# Altium schematic sheet ADP1741_3.6V_3.3V@2A.SchDoc
size A4
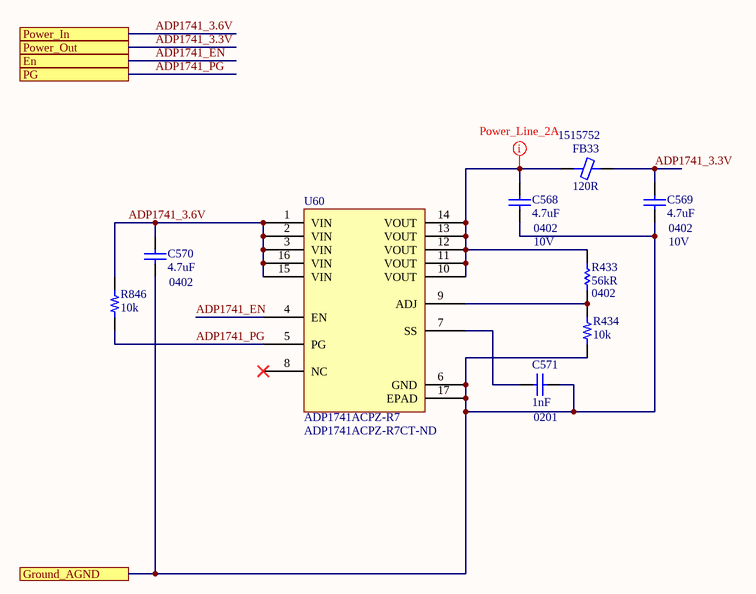
[diagram p0: ADP1741_3.6V_3.3V@2A.SchDoc]

## Parts
C568  4.7uF  Case/Package: 0402  Voltage Rating: 10V  [CAP 0402/1005 KK]
C569  4.7uF  Case/Package: 0402  Voltage Rating: 10V  [CAP 0402/1005 KK]
C570  4.7uF  Case/Package: 0402  [CAP 0402/1005 KK]
C571  1nF  Case/Package: 0201  [CAP 0201/0603 KK]
FB33  120R  Supplier Part Number 1: 1515752  [FER 0603/1608]
R433  56kR  Case/Package: 0402  [RES 0402/1005 RF KK]
R434  10k  [RES 0402/1005 RF KK]
R846  10k  [RES 0402/1005 RF KK]
U60  ADP1741ACPZ-R7  Supplier Part Number 1: ADP1741ACPZ-R7CT-ND  [ADP1752_1753/ADP1740_1741]

## Ports
En, Ground_AGND, PG, Power_In, Power_Out

## Nets
ADP1741_3.3V: C569.2 FB33.2 ; port Power_Out
ADP1741_3.6V: C570.2 R846.1 U60.1(VIN) U60.2(VIN) U60.3(VIN) U60.15(VIN) U60.16(VIN) ; port Power_In
ADP1741_EN: U60.4(EN) ; port En
ADP1741_PG: R846.2 U60.5(PG) ; port PG
Ground_AGND: C568.1 C569.1 C570.1 C571.2 R434.2 U60.6(GND) U60.17(EPAD) ; port Ground_AGND
NetC568_2: C568.2 FB33.1 R433.2 U60.10(VOUT) U60.11(VOUT) U60.12(VOUT) U60.13(VOUT) U60.14(VOUT)
NetC571_1: C571.1 U60.7(SS)
NetR433_1: R433.1 R434.1 U60.9(ADJ)

Not connected (* = marked no-connect by the designer): U60 8(NC)*

## Layout directives
net class Power_Line_2A: NetC568_2

## Notes on the sheet
- Title
- Size:
- Date:
- A3
- Number:
- Time:
- Revision:
- Sheet
- of
- File:

## Library data of the parts
C568 C569 = Capacitor: 0402 10 V 4.7 uF ±20% Tolerance X5R Multilayer Ceramic Chip Capacitor; Manufacturer: Murata; Manufacturer Part Number: GRM155R61A475MEAAD; Supplier 1: Digi-Key; Supplier Part Number 1: 490-14306-1-ND; Category: Ceramic Capacitors; Stock 1: 980102; Pricing 1: 1=0,23000, 10=0,15400, 100=0,07780, 500=0,05322, 1000=0,04708, 2500=0,04504, 5000=0,04094 (USD); Mount: Surface Mount; Case Code (Imperial): 0402; Case Code (Metric): 1005; Min Operating Temperature: -55°C; Max Operating Temperature: 85°C; Packaging: Tape and Reel; Capacitance: 4.7uF; Tolerance: 20%; ComponentLink1URL: http://www.farnell.com/datasheets/2189109.pdf?src-supplier=Farnell; ComponentLink1Description: http://www.farnell.com/datasheets/2189109.pdf?src-supplier=Farnell; ComponentLink2URL: https://search.murata.co.jp/Ceramy/image/img/A01X/G101/ENG/GRM155R61A475MEAA-01.pdf?src-supplier=Digi-Key; ComponentLink2Description: https://search.murata.co.jp/Ceramy/image/img/A01X/G101/ENG/GRM155R61A475MEAA-01.pdf?src-supplier=Digi-Key; ComponentLink3URL: http://datasheet.octopart.com/GRM155R61A475MEAAD-Murata-datasheet-68589269.pdf?src-supplier=Newark; ComponentLink3Description: http://datasheet.octopart.com/GRM155R61A475MEAAD-Murata-datasheet-68589269.pdf?src-supplier=Newark; ComponentLink4URL: http://datasheet.octopart.com/GRM155R61A475MEAAD-Murata-datasheet-8819587.pdf; ComponentLink4Description: http://datasheet.octopart.com/GRM155R61A475MEAAD-Murata-datasheet-8819587.pdf; ComponentLink5URL: http://datasheet.octopart.com/GRM155R61A475MEAAD-Murata-datasheet-10025737.pdf; ComponentLink5Description: http://datasheet.octopart.com/GRM155R61A475MEAAD-Murata-datasheet-10025737.pdf; ComponentLink6URL: http://datasheet.octopart.com/GRM155R61A475MEAAD-Murata-datasheet-11978611.pdf; ComponentLink6Description: http://datasheet.octopart.com/GRM155R61A475MEAAD-Murata-datasheet-11978611.pdf; ComponentLink7URL: http://datasheet.octopart.com/GRM155R61A475MEAAD-Murata-datasheet-12510076.pdf; ComponentLink7Description: http://datasheet.octopart.com/GRM155R61A475MEAAD-Murata-datasheet-12510076.pdf; ComponentLink8URL: http://datasheet.octopart.com/GRM155R61A475MEAAD-Murata-datasheet-12515295.pdf; ComponentLink8Description: http://datasheet.octopart.com/GRM155R61A475MEAAD-Murata-datasheet-12515295.pdf
C570 = Capacitor: 0402 10 V 4.7 uF ±20% Tolerance X5R Multilayer Ceramic Chip Capacitor; Manufacturer: Murata; Manufacturer Part Number: GRM155R61A475MEAAD; Voltage Rating: 10V; Supplier 1: Digi-Key; Supplier Part Number 1: 490-14306-1-ND; Category: Ceramic Capacitors; Stock 1: 980102; Pricing 1: 1=0,23000, 10=0,15400, 100=0,07780, 500=0,05322, 1000=0,04708, 2500=0,04504, 5000=0,04094 (USD); Mount: Surface Mount; Case Code (Imperial): 0402; Case Code (Metric): 1005; Min Operating Temperature: -55°C; Max Operating Temperature: 85°C; Packaging: Tape and Reel; Capacitance: 4.7uF; Tolerance: 20%; ComponentLink1URL: http://www.farnell.com/datasheets/2189109.pdf?src-supplier=Farnell; ComponentLink1Description: http://www.farnell.com/datasheets/2189109.pdf?src-supplier=Farnell; ComponentLink2URL: https://search.murata.co.jp/Ceramy/image/img/A01X/G101/ENG/GRM155R61A475MEAA-01.pdf?src-supplier=Digi-Key; ComponentLink2Description: https://search.murata.co.jp/Ceramy/image/img/A01X/G101/ENG/GRM155R61A475MEAA-01.pdf?src-supplier=Digi-Key; ComponentLink3URL: http://datasheet.octopart.com/GRM155R61A475MEAAD-Murata-datasheet-68589269.pdf?src-supplier=Newark; ComponentLink3Description: http://datasheet.octopart.com/GRM155R61A475MEAAD-Murata-datasheet-68589269.pdf?src-supplier=Newark; ComponentLink4URL: http://datasheet.octopart.com/GRM155R61A475MEAAD-Murata-datasheet-8819587.pdf; ComponentLink4Description: http://datasheet.octopart.com/GRM155R61A475MEAAD-Murata-datasheet-8819587.pdf; ComponentLink5URL: http://datasheet.octopart.com/GRM155R61A475MEAAD-Murata-datasheet-10025737.pdf; ComponentLink5Description: http://datasheet.octopart.com/GRM155R61A475MEAAD-Murata-datasheet-10025737.pdf; ComponentLink6URL: http://datasheet.octopart.com/GRM155R61A475MEAAD-Murata-datasheet-11978611.pdf; ComponentLink6Description: http://datasheet.octopart.com/GRM155R61A475MEAAD-Murata-datasheet-11978611.pdf; ComponentLink7URL: http://datasheet.octopart.com/GRM155R61A475MEAAD-Murata-datasheet-12510076.pdf; ComponentLink7Description: http://datasheet.octopart.com/GRM155R61A475MEAAD-Murata-datasheet-12510076.pdf; ComponentLink8URL: http://datasheet.octopart.com/GRM155R61A475MEAAD-Murata-datasheet-12515295.pdf; ComponentLink8Description: http://datasheet.octopart.com/GRM155R61A475MEAAD-Murata-datasheet-12515295.pdf
C571 = Capacitor: CAP CER 1000PF 25V X5R 0201; Manufacturer: Murata; Manufacturer Part Number: GRM033R61E102KA01D; Tolerance: 10%; Supplier 1: Digi-Key; Supplier Part Number 1: 490-14452-1-ND; RoHS: Yes; Category: Ceramic Capacitors; Stock 1: 80983; Pricing 1: 1=0,10000, 10=0,01800, 100=0,00790, 500=0,00564, 1000=0,00443, 2500=0,00402, 5000=0,00370 (USD); Min Operating Temperature: -55°C; Max Operating Temperature: 85°C; Packaging: Tape and Reel; Capacitance: 1nF; Dielectric: X5R; Voltage Rating (DC): 25V; Length: 0.6mm; Depth: 0.3mm; Width: 300um; Thickness: 300um; ComponentLink1URL: http://components.arrow.com/part/dataview/0323_06094941?src-supplier=Arrow+Europe; ComponentLink1Description: http://components.arrow.com/part/dataview/0323_06094941?src-supplier=Arrow+Europe; ComponentLink2URL: https://search.murata.co.jp/Ceramy/image/img/A01X/G101/ENG/GRM033R61E102KA01-01.pdf?src-supplier=Digi-Key; ComponentLink2Description: https://search.murata.co.jp/Ceramy/image/img/A01X/G101/ENG/GRM033R61E102KA01-01.pdf?src-supplier=Digi-Key; ComponentLink3URL: http://search.murata.co.jp/Ceramy/image/img/A01X/G101/ENG/GRM033R61E102KA01-01.pdf?src-supplier=Digi-Key; ComponentLink3Description: http://search.murata.co.jp/Ceramy/image/img/A01X/G101/ENG/GRM033R61E102KA01-01.pdf?src-supplier=Digi-Key
FB33 = Ferrite: Ind Chip Bead 120Ohm 25% 100MHz Ferrite 3A 0603 Paper T/R; Manufacturer: Murata; Manufacturer Part Number: BLM18SG121TN1D; Material: Steel,Ferrite; DC Resistance (DCR): 25mR; Number of Circuits: 1; Shielding: Unshielded; Supplier 1: Farnell; RoHS: Yes; Category: Ferrite Beads and Chips; Stock 1: 47191; Case/Package: 0603; Number of Pins: 2; Core Material: Ferrite; Case Code (Metric): 1608; Case Code (Imperial): 0603; Min Operating Temperature: -55°C; Max Operating Temperature: 125°C; Impedance: 120R; Packaging: Tape and Reel; Current Rating: 3A; Tolerance: 25%; Max DC Current: 3A; Package Quantity: 1; Max Current Rating: 3A; Number of Lines: 1; Termination: SMD/SMT; Test Frequency: 100MHz; Frequency: 100MHz; Length: 1.6mm; Height: 0.8mm; Width: 0.8mm; Depth: 0.8mm; REACH SVHC: No SVHC; Lead Free: Lead Free; ComponentLink1URL: https://datasheet.ciiva.com/1012/l0110s0100blm18s-1012624.pdf?src-supplier=Digi-Key; ComponentLink1Description: https://datasheet.ciiva.com/1012/l0110s0100blm18s-1012624.pdf?src-supplier=Digi-Key; ComponentLink2URL: https://datasheet.ciiva.com/18093/getdatasheetpartid-295885-18093249.pdf?src-supplier=Verical; ComponentLink2Description: https://datasheet.ciiva.com/18093/getdatasheetpartid-295885-18093249.pdf?src-supplier=Verical; ComponentLink3URL: https://datasheet.ciiva.com/11799/0900766b811b5866-11799181.pdf?src-supplier=RSComponents; ComponentLink3Description: https://datasheet.ciiva.com/11799/0900766b811b5866-11799181.pdf?src-supplier=RSComponents; ComponentLink4URL: https://datasheet.ciiva.com/41449/001171723-da-01-en-chip-drossel0603-120r-3000ma-1-6x0-8mm-41449353.pdf?src-supplier=Conrad; ComponentLink4Description: https://datasheet.ciiva.com/41449/001171723-da-01-en-chip-drossel0603-120r-3000ma-1-6x0-8mm-41449353.pdf?src-supplier=Conrad; ComponentLink5URL: https://datasheet.ciiva.com/41449/001172312-da-01-en-drossel-0603-120r-1-6x0-8mm-10000st-41449675.pdf?src-supplier=Conrad; ComponentLink5Description: https://datasheet.ciiva.com/41449/001172312-da-01-en-drossel-0603-120r-1-6x0-8mm-10000st-41449675.pdf?src-supplier=Conrad; ComponentLink6URL: https://datasheet.ciiva.com/1012/l0110s0100blm18s-1012625.pdf?src-supplier=Digi-Key; ComponentLink6Description: https://datasheet.ciiva.com/1012/l0110s0100blm18s-1012625.pdf?src-supplier=Digi-Key; ComponentLink7URL: https://datasheet.ciiva.com/8021/5151-8021511.pdf?src-supplier=Element14; ComponentLink7Description: https://datasheet.ciiva.com/8021/5151-8021511.pdf?src-supplier=Element14; ComponentLink8URL: https://datasheet.ciiva.com/8021/5151-8021512.pdf?src-supplier=Element14; ComponentLink8Description: https://datasheet.ciiva.com/8021/5151-8021512.pdf?src-supplier=Element14; ComponentLink9URL: https://datasheet.ciiva.com/14122/blm-series-eng-tds-14122906.pdf?src-supplier=Distrelec; ComponentLink9Description: https://datasheet.ciiva.com/14122/blm-series-eng-tds-14122906.pdf?src-supplier=Distrelec; ComponentLink10URL: https://datasheet.ciiva.com/16395/l0110s0100blm18s-16395498.pdf?src-supplier=Future+Electronics; ComponentLink10Description: https://datasheet.ciiva.com/16395/l0110s0100blm18s-16395498.pdf?src-supplier=Future+Electronics; ComponentLink11URL: https://datasheet.ciiva.com/1012/l0110s0100blm18s-1012623.pdf?src-supplier=Digi-Key; ComponentLink11Description: https://datasheet.ciiva.com/1012/l0110s0100blm18s-1012623.pdf?src-supplier=Digi-Key; ComponentLink12URL: https://datasheet.ciiva.com/17246/l0110s0100blm18s-17246943.pdf?src-supplier=Avnet+Europe; ComponentLink12Description: https://datasheet.ciiva.com/17246/l0110s0100blm18s-17246943.pdf?src-supplier=Avnet+Europe
R433 = Resistor: RES 56K OHM 1% 1/16W 0402; Manufacturer: Stackpole Electronics; Manufacturer Part Number: RMCF0402FT56K0; Max Power Dissipation: 63mW; Temperature Coefficient: 100ppm/°C; Supplier 1: Digi-Key; Supplier Part Number 1: RMCF0402FT56K0CT-ND; RoHS: Yes; Category: Chip SMD Resistors; Stock 1: 59738; Pricing 1: 1=0,10000, 10=0,01400, 100=0,00580, 1000=0,00262, 2500=0,00228, 5000=0,00188 (USD); Mount: Surface Mount; Case Code (Metric): 1005; Case Code (Imperial): 0402; Contact Plating: Tin,Matte; Min Operating Temperature: -55°C; Max Operating Temperature: 155°C; Packaging: Tape and Reel; Resistance: 56kR; Tolerance: 1%; Package Quantity: 10000; Composition: Thick Film; Number of Terminations: 2; Features: Automotive AEC-Q200; Length: 0.039inch; Height: 0.016inch; Width: 0.02inch; Radiation Hardening: No; ComponentLink1URL: https://www.seielect.com/catalog/SEI-RMCF_RMCP.pdf?src-supplier=Avnet; ComponentLink1Description: https://www.seielect.com/catalog/SEI-RMCF_RMCP.pdf?src-supplier=Avnet; ComponentLink2URL: http://www.seielect.com/Catalog/SEI-RMCF_RMCP.pdf?src-supplier=Digi-Key; ComponentLink2Description: http://www.seielect.com/Catalog/SEI-RMCF_RMCP.pdf?src-supplier=Digi-Key; ComponentLink3URL: https://www.seielect.com/catalog/SEI-Packaging.pdf?src-supplier=Digi-Key; ComponentLink3Description: https://www.seielect.com/catalog/SEI-Packaging.pdf?src-supplier=Digi-Key; ComponentLink4URL: https://www.seielect.com/Catalog/SEI-RMCF_RMCP.pdf?src-supplier=Digi-Key; ComponentLink4Description: https://www.seielect.com/Catalog/SEI-RMCF_RMCP.pdf?src-supplier=Digi-Key
R434 R846 = Resistor: SMT Resistor; Value: 10k; Part Number: *; Supplier 1: Digi-Key; Supplier Part Number 1: RR05P10.0KDCT-ND
U60 = ADP1741ACPZ-R7: IC REG LIN POS ADJ 2A 16LFCSP; Manufacturer: Analog Devices; Output Voltage: 3V; Max Input Voltage: 3.6V; Min Input Voltage: 1.6V; Min Output Voltage: 750mV; Operating Supply Current: 1.8mA; Power Supply Rejection Ratio (PSRR): 70dB; Dropout Voltage: 160mV; Number of Outputs: 1; Min Current Limit: 2.4A; Polarity: Positive; Accuracy: 1%; Output Type: Adjustable; Supplier 1: Digi-Key; Manufacturer Part Number: ADP1741ACPZ-R7; Stock 1: 7057; Pricing 1: 1 = 3,42000, 10 = 3,07000, 25 = 2,90240, 100 = 2,51540, 250 = 2,38644, 500 = 2,14136 (USD); RoHS: Yes; Case/Package: LFCSP EP; Number of Pins: 16; Min Operating Temperature: -40°C; Max Operating Temperature: 125°C; Output Current: 2A; Max Output Current: 2A; Packaging: Tape and Reel; Max Output Voltage: 3V; Max Supply Current: 1.8mA; Number of Regulators: 1; Output Voltage Accuracy: 1%; Radiation Hardening: No; REACH SVHC: No SVHC; Lead Free: Contains Lead; ComponentLink1URL: https://datasheet.ciiva.com/2041/adp1740-1741-2041344.pdf?src-supplier=Digi-Key; ComponentLink1Description: https://datasheet.ciiva.com/2041/adp1740-1741-2041344.pdf?src-supplier=Digi-Key; ComponentLink2URL: https://datasheet.ciiva.com/15364/adp1740-1741-259394-15364336.pdf?src-supplier=Mouser; ComponentLink2Description: https://datasheet.ciiva.com/15364/adp1740-1741-259394-15364336.pdf?src-supplier=Mouser; ComponentLink3URL: https://datasheet.ciiva.com/23604/697190-23604608.pdf?src-supplier=Newark; ComponentLink3Description: https://datasheet.ciiva.com/23604/697190-23604608.pdf?src-supplier=Newark; ComponentLink4URL: https://datasheet.ciiva.com/2041/adp1740-1741-2041345.pdf?src-supplier=Digi-Key; ComponentLink4Description: https://datasheet.ciiva.com/2041/adp1740-1741-2041345.pdf?src-supplier=Digi-Key; ComponentLink5URL: https://datasheet.ciiva.com/3224/adp1740-1741-3224694.pdf?src-supplier=Avnet; ComponentLink5Description: https://datasheet.ciiva.com/3224/adp1740-1741-3224694.pdf?src-supplier=Avnet; ComponentLink6URL: https://datasheet.ciiva.com/17365/adp1740-1741-17365261.pdf?src-supplier=Avnet+Europe; ComponentLink6Description: https://datasheet.ciiva.com/17365/adp1740-1741-17365261.pdf?src-supplier=Avnet+Europe; ComponentLink7URL: https://datasheet.ciiva.com/2041/adp1740-1741-2041343.pdf?src-supplier=Digi-Key; ComponentLink7Description: https://datasheet.ciiva.com/2041/adp1740-1741-2041343.pdf?src-supplier=Digi-Key